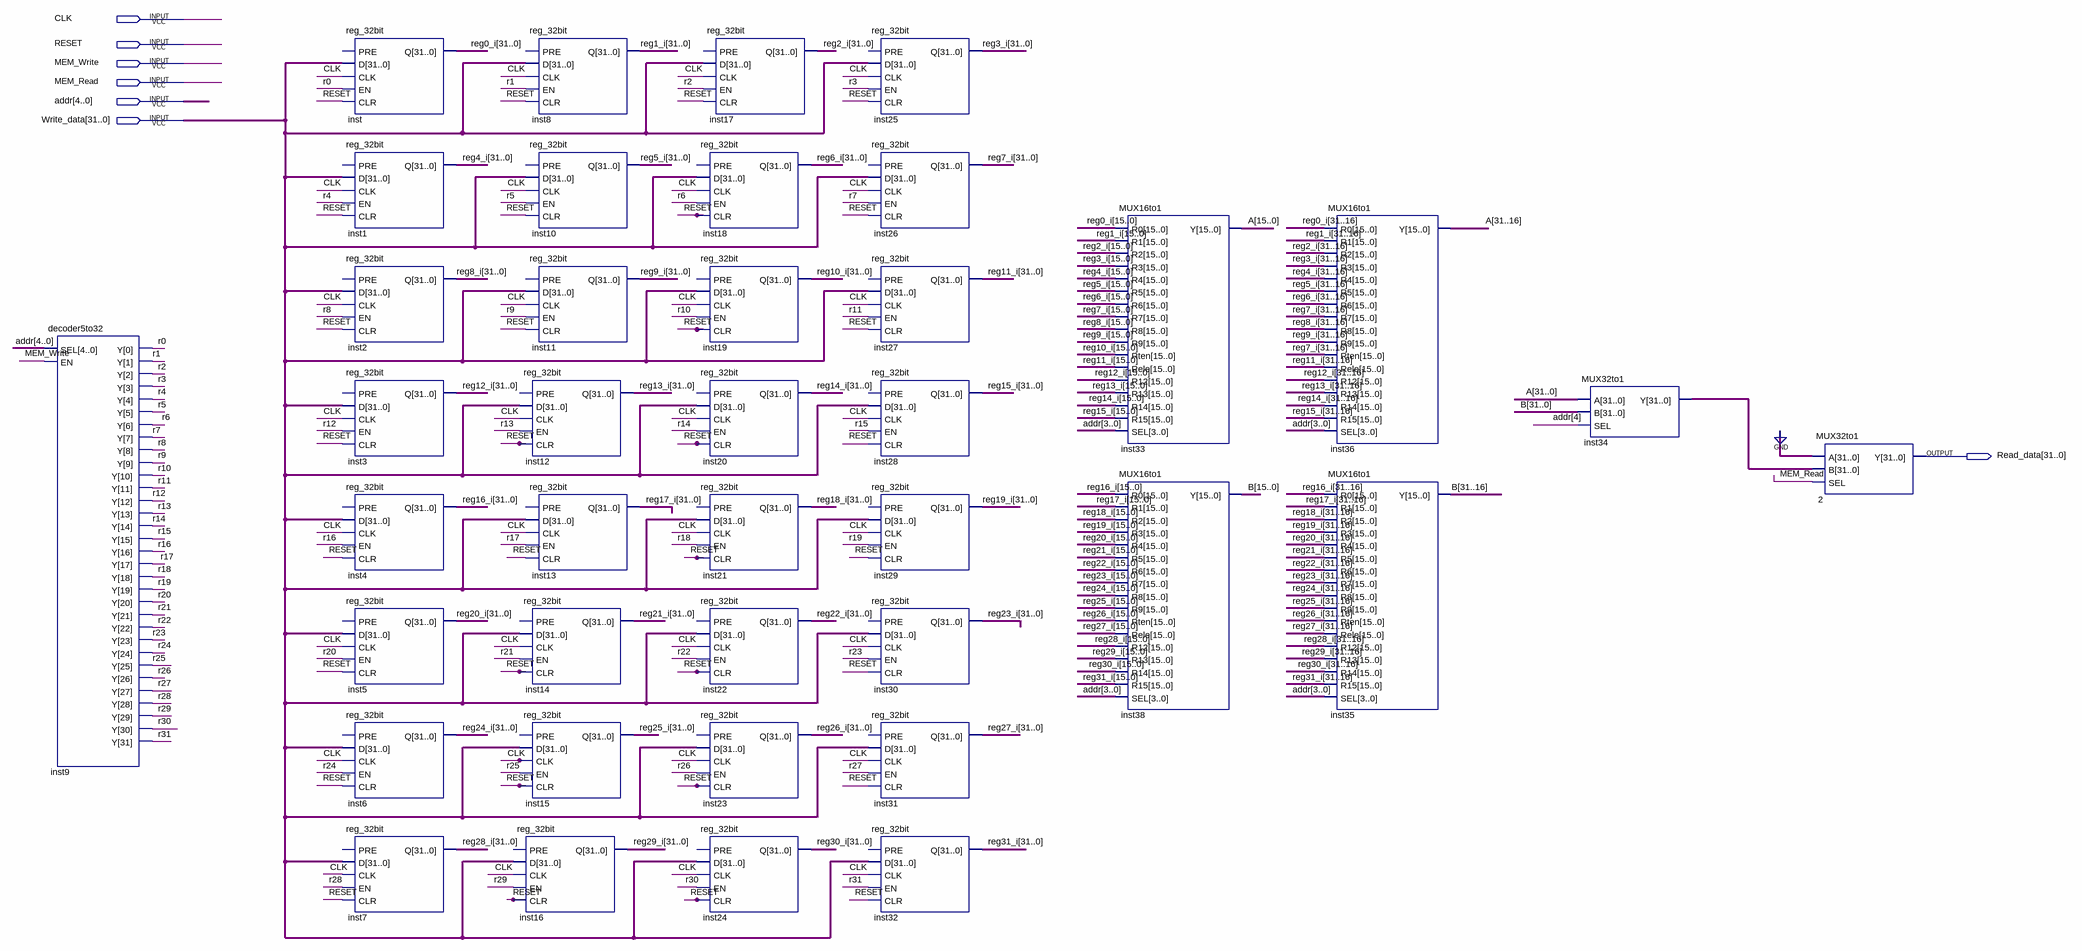
[diagram p0: schematic sheet]
// Quartus schematic DMEM.bdf as structural Verilog: 39 symbols, 7 pins
module DMEM (
  input  CLK,
  input  RESET,
  input  MEM_Write,
  input  MEM_Read,
  input  [4:0] addr,
  input  [31:0] Write_data,
  output [31:0] Read_data
);

  wire r0, r1, r2, r3, r4, r5, r6, r7, r8, r9, r10, r11, r12, r13, r14, r15, r16, r17, r18, r19, r20, r21,
       r22, r23, r24, r25, r26, r27, r28, r29, r30, r31;
  wire [31:0] A, B, inst34_y, reg0_i, reg1_i, reg2_i, reg3_i, reg4_i, reg5_i, reg6_i, reg7_i, reg8_i, reg9_i,
       reg10_i, reg11_i, reg12_i, reg13_i, reg14_i, reg15_i, reg16_i, reg17_i, reg18_i, reg19_i, reg20_i,
       reg21_i, reg22_i, reg23_i, reg24_i, reg25_i, reg26_i, reg27_i, reg28_i, reg29_i, reg30_i, reg31_i;

  decoder5to32 inst9 (
    .SEL(addr), .EN(MEM_Write),
    .Y({r31, r30, r29, r28, r27, r26, r25, r24, r23, r22, r21, r20, r19, r18, r17, r16, r15, r14, r13, r12, r11, r10, r9, r8, r7, r6, r5, r4, r3, r2, r1, r0}));
  reg_32bit inst (.D(Write_data), .CLK(CLK), .EN(r0), .CLR(RESET), .Q(reg0_i));  // open: PRE
  reg_32bit inst1 (.D(Write_data), .CLK(CLK), .EN(r4), .CLR(RESET), .Q(reg4_i));  // open: PRE
  reg_32bit inst2 (.D(Write_data), .CLK(CLK), .EN(r8), .CLR(RESET), .Q(reg8_i));  // open: PRE
  reg_32bit inst3 (.D(Write_data), .CLK(CLK), .EN(r12), .CLR(RESET), .Q(reg12_i));  // open: PRE
  reg_32bit inst4 (.D(Write_data), .CLK(CLK), .EN(r16), .CLR(RESET), .Q(reg16_i));  // open: PRE
  reg_32bit inst5 (.D(Write_data), .CLK(CLK), .EN(r20), .CLR(RESET), .Q(reg20_i));  // open: PRE
  reg_32bit inst6 (.D(Write_data), .CLK(CLK), .EN(r24), .CLR(RESET), .Q(reg24_i));  // open: PRE
  reg_32bit inst7 (.D(Write_data), .CLK(CLK), .EN(r28), .CLR(RESET), .Q(reg28_i));  // open: PRE
  reg_32bit inst8 (.D(Write_data), .CLK(CLK), .EN(r1), .CLR(RESET), .Q(reg1_i));  // open: PRE
  reg_32bit inst10 (.D(Write_data), .CLK(CLK), .EN(r5), .CLR(RESET), .Q(reg5_i));  // open: PRE
  reg_32bit inst11 (.D(Write_data), .CLK(CLK), .EN(r9), .CLR(RESET), .Q(reg9_i));  // open: PRE
  reg_32bit inst12 (.D(Write_data), .CLK(CLK), .EN(r13), .CLR(RESET), .Q(reg13_i));  // open: PRE
  reg_32bit inst13 (.D(Write_data), .CLK(CLK), .EN(r17), .CLR(RESET), .Q(reg17_i));  // open: PRE
  reg_32bit inst14 (.D(Write_data), .CLK(CLK), .EN(r21), .CLR(RESET), .Q(reg21_i));  // open: PRE
  reg_32bit inst15 (.D(Write_data), .CLK(CLK), .EN(r25), .CLR(RESET), .Q(reg25_i));  // open: PRE
  reg_32bit inst16 (.D(Write_data), .CLK(CLK), .EN(r29), .CLR(RESET), .Q(reg29_i));  // open: PRE
  reg_32bit inst17 (.D(Write_data), .CLK(CLK), .EN(r2), .CLR(RESET), .Q(reg2_i));  // open: PRE
  reg_32bit inst18 (.D(Write_data), .CLK(CLK), .EN(r6), .CLR(RESET), .Q(reg6_i));  // open: PRE
  reg_32bit inst19 (.D(Write_data), .CLK(CLK), .EN(r10), .CLR(RESET), .Q(reg10_i));  // open: PRE
  reg_32bit inst20 (.D(Write_data), .CLK(CLK), .EN(r14), .CLR(RESET), .Q(reg14_i));  // open: PRE
  reg_32bit inst21 (.D(Write_data), .CLK(CLK), .EN(r18), .CLR(RESET), .Q(reg18_i));  // open: PRE
  reg_32bit inst22 (.D(Write_data), .CLK(CLK), .EN(r22), .CLR(RESET), .Q(reg22_i));  // open: PRE
  reg_32bit inst23 (.D(Write_data), .CLK(CLK), .EN(r26), .CLR(RESET), .Q(reg26_i));  // open: PRE
  reg_32bit inst24 (.D(Write_data), .CLK(CLK), .EN(r30), .CLR(RESET), .Q(reg30_i));  // open: PRE
  reg_32bit inst25 (.D(Write_data), .CLK(CLK), .EN(r3), .CLR(RESET), .Q(reg3_i));  // open: PRE
  reg_32bit inst26 (.D(Write_data), .CLK(CLK), .EN(r7), .CLR(RESET), .Q(reg7_i));  // open: PRE
  reg_32bit inst27 (.D(Write_data), .CLK(CLK), .EN(r11), .CLR(RESET), .Q(reg11_i));  // open: PRE
  reg_32bit inst28 (.D(Write_data), .CLK(CLK), .EN(r15), .CLR(RESET), .Q(reg15_i));  // open: PRE
  reg_32bit inst29 (.D(Write_data), .CLK(CLK), .EN(r19), .CLR(RESET), .Q(reg19_i));  // open: PRE
  reg_32bit inst30 (.D(Write_data), .CLK(CLK), .EN(r23), .CLR(RESET), .Q(reg23_i));  // open: PRE
  reg_32bit inst31 (.D(Write_data), .CLK(CLK), .EN(r27), .CLR(RESET), .Q(reg27_i));  // open: PRE
  reg_32bit inst32 (.D(Write_data), .CLK(CLK), .EN(r31), .CLR(RESET), .Q(reg31_i));  // open: PRE
  MUX16to1 inst33 (
    .R0(reg0_i[15:0]), .R1(reg1_i[15:0]), .R2(reg2_i[15:0]), .R3(reg3_i[15:0]), .R4(reg4_i[15:0]),
    .R5(reg5_i[15:0]), .R6(reg6_i[15:0]), .R7(reg7_i[15:0]), .R8(reg8_i[15:0]), .R9(reg9_i[15:0]),
    .Rten(reg10_i[15:0]), .Rele(reg11_i[15:0]), .R12(reg12_i[15:0]), .R13(reg13_i[15:0]),
    .R14(reg14_i[15:0]), .R15(reg15_i[15:0]), .SEL(addr[3:0]), .Y(A[15:0]));
  MUX16to1 inst38 (
    .R0(reg16_i[15:0]), .R1(reg17_i[15:0]), .R2(reg18_i[15:0]), .R3(reg19_i[15:0]), .R4(reg20_i[15:0]),
    .R5(reg21_i[15:0]), .R6(reg22_i[15:0]), .R7(reg23_i[15:0]), .R8(reg24_i[15:0]), .R9(reg25_i[15:0]),
    .Rten(reg26_i[15:0]), .Rele(reg27_i[15:0]), .R12(reg28_i[15:0]), .R13(reg29_i[15:0]),
    .R14(reg30_i[15:0]), .R15(reg31_i[15:0]), .SEL(addr[3:0]), .Y(B[15:0]));
  MUX16to1 inst36 (
    .R0(reg0_i[31:16]), .R1(reg1_i[31:16]), .R2(reg2_i[31:16]), .R3(reg3_i[31:16]), .R4(reg4_i[31:16]),
    .R5(reg5_i[31:16]), .R6(reg6_i[31:16]), .R7(reg7_i[31:16]), .R8(reg8_i[31:16]), .R9(reg9_i[31:16]),
    .Rten(reg7_i[31:16]), .Rele(reg11_i[31:16]), .R12(reg12_i[31:16]), .R13(reg13_i[31:16]),
    .R14(reg14_i[31:16]), .R15(reg15_i[31:16]), .SEL(addr[3:0]), .Y(A[31:16]));
  MUX16to1 inst35 (
    .R0(reg16_i[31:16]), .R1(reg17_i[31:16]), .R2(reg18_i[31:16]), .R3(reg19_i[31:16]), .R4(reg20_i[31:16]),
    .R5(reg21_i[31:16]), .R6(reg22_i[31:16]), .R7(reg23_i[31:16]), .R8(reg24_i[31:16]), .R9(reg25_i[31:16]),
    .Rten(reg26_i[31:16]), .Rele(reg27_i[31:16]), .R12(reg28_i[31:16]), .R13(reg29_i[31:16]),
    .R14(reg30_i[31:16]), .R15(reg31_i[31:16]), .SEL(addr[3:0]), .Y(B[31:16]));
  MUX32to1 inst34 (.A(A), .B(B), .SEL(addr[4]), .Y(inst34_y));
  MUX32to1 u_2 (.A({32{1'b0}}), .B(inst34_y), .SEL(MEM_Read), .Y(Read_data));
endmodule
